# Altium schematic sheet Driver_3.SchDoc
size A; SheetNumber: 6; SheetTotal: 7
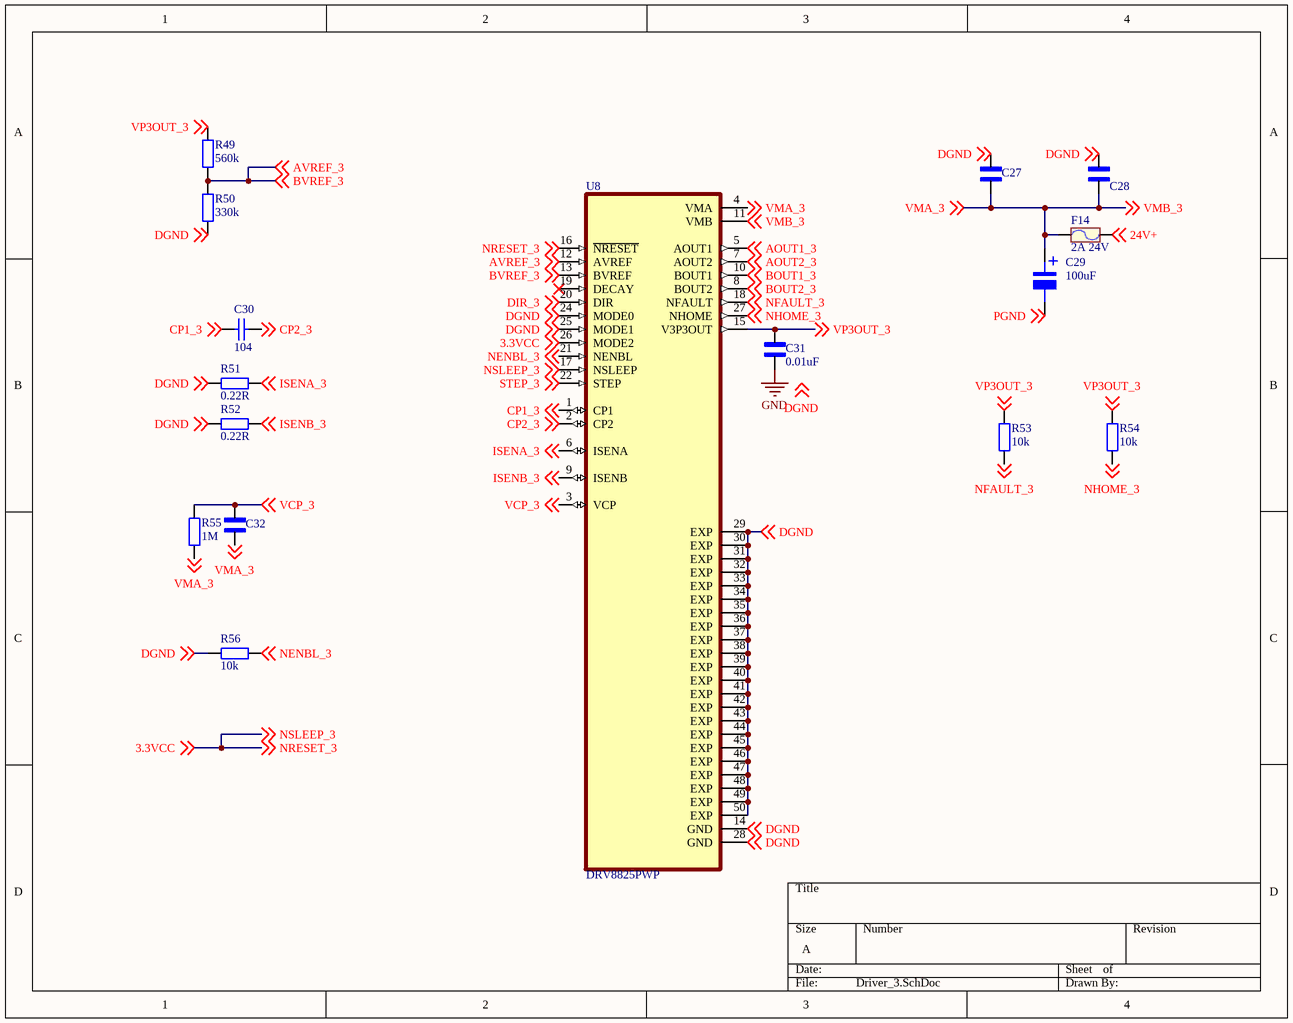
[diagram p0: Driver_3.SchDoc]

## Parts
C27  C0402C104K3RACTU  [CAPC1005X55N]  (value not drawn)
C28  C0402C104K3RACTU  [CAPC1005X55N]  (value not drawn)
C29  100uF  [tu nhom 6.3 (d)]
C30  104  [tu 1206]
C31  0.01uF  [CAPC1608X90N]
C32  C0402C104K3RACTU  [CAPC1005X55N]  (value not drawn)
F14  2A 24V  [Cau chi tu phuc hoi 2A 24V SMD1812]
R49  560k  [Tro SMD 0805]
R50  330k  [Tro SMD 0805]
R51  0.22R  [tro smd 0805]
R52  0.22R  [tro smd 0805]
R53  10k  [tro smd 0805]
R54  10k  [tro smd 0805]
R55  1M  [tro smd 0805]
R56  10k  [tro smd 0805]
U8  DRV8825PWP  [IC_TPS61196PWPRQ1]

## Nets
GND: C31.1
3.3VCC: U8.16(~{NRESET}) U8.17(NSLEEP) U8.26(MODE2) ; off-sheet 3.3VCC, off-sheet NRESET_3, off-sheet NSLEEP_3  [also labelled NRESET_3, NSLEEP_3]
24V+: F14.2 ; off-sheet 24V+
AOUT1_3: U8.5(AOUT1) ; off-sheet AOUT1_3
AOUT2_3: U8.7(AOUT2) ; off-sheet AOUT2_3
AVREF_3: R49.1 R50.2 U8.12(AVREF) U8.13(BVREF) ; off-sheet AVREF_3, off-sheet BVREF_3  [also labelled BVREF_3]
BOUT1_3: U8.10(BOUT1) ; off-sheet BOUT1_3
BOUT2_3: U8.8(BOUT2) ; off-sheet BOUT2_3
CP1_3: C30.1 U8.1(CP1) ; off-sheet CP1_3
CP2_3: C30.2 U8.2(CP2) ; off-sheet CP2_3
DGND: C27.2 C28.2 R50.1 R51.1 R52.1 R56.1 U8.14(GND) U8.24(MODE0) U8.25(MODE1) U8.28(GND) U8.29(EXP) U8.30(EXP) U8.31(EXP) U8.32(EXP) U8.33(EXP) U8.34(EXP) U8.35(EXP) U8.36(EXP) U8.37(EXP) U8.38(EXP) U8.39(EXP) U8.40(EXP) U8.41(EXP) U8.42(EXP) U8.43(EXP) U8.44(EXP) U8.45(EXP) U8.46(EXP) U8.47(EXP) U8.48(EXP) U8.49(EXP) U8.50(EXP) ; off-sheet DGND
DIR_3: U8.20(DIR) ; off-sheet DIR_3
ISENA_3: R51.2 U8.6(ISENA) ; off-sheet ISENA_3
ISENB_3: R52.2 U8.9(ISENB) ; off-sheet ISENB_3
NENBL_3: R56.2 U8.21(NENBL) ; off-sheet NENBL_3
NFAULT_3: R53.1 U8.18(NFAULT) ; off-sheet NFAULT_3
NHOME_3: R54.1 U8.27(NHOME) ; off-sheet NHOME_3
PGND: C29.2 ; off-sheet PGND
STEP_3: U8.22(STEP) ; off-sheet STEP_3
VCP_3: C32.2 R55.2 U8.3(VCP) ; off-sheet VCP_3
VMA_3: C27.1 C28.1 C29.1 C32.1 F14.1 R55.1 U8.4(VMA) U8.11(VMB) ; off-sheet VMA_3, off-sheet VMB_3  [also labelled VMB_3]
VP3OUT_3: C31.2 R49.2 R53.2 R54.2 U8.15(V3P3OUT) ; off-sheet VP3OUT_3

Not connected (* = marked no-connect by the designer): U8 19(DECAY)*

## Notes on the sheet
- Labels drawn without touching a wire or pin: DGND
- (in symbol Tu Nhom 100uF 16V) +

## Library data of the parts
C27 C28 C32 = C0402C104K3RACTU: MF: {'manufacturer': u'KEMET'}; Package: None; Price: None; Value: *; MP: C0402C104K3RACTU; Availability: Unavailable
C29 = Tu Nhom 100uF 16V: Dán; Don_Vi: Con; So_Chan: 2; Ten_Linh_Kien: Tụ Nhôm 100uF 16V 6.3x5.4MM; Ma_Hang: MH002219; Chung_Loai: Dán; Kieu_Chan: *
C30 = Tu 1206 104 50V 20%: Dán; Don_Vi: Con; So_Chan: 2; Ten_Linh_Kien: Tụ 1206 104-0.1uF 20% 50V; Ma_Hang: MH004544; Chung_Loai: Dán; Kieu_Chan: *
C31 = GCE188R72A103KA01D: 0603 0.01 uF 100 V Â±10% Tolerance X7R Multilayer Ceramic Capacitor; MF: Murata; Package: 1608 Murata; Check_prices: https://www.snapeda.com/parts/GCE188R72A103KA01D/Murata%20Electronics%20North%20America/view-part/1764845/?ref=eda; Value: *; Price: None; Purchase-URL: https://pricing.snapeda.com/search/part/GCE188R72A103KA01D/?ref=eda; MP: GCE188R72A103KA01D; Availability: Good; SnapEDA_Link: https://www.snapeda.com/parts/GCE188R72A103KA01D/Murata%20Electronics%20North%20America/view-part/1764845/?ref=snap
F14 = Cau chi tu phuc hoi 2A 24V SMD1812: 2A 24V SMD1812; Ma_Hang: MH010033; Ten: Cầu Chì Tự Phục Hồi 2A 24V SMD1812
R49 = Tro 0805 5% 560k: Dán; Don_Vi: Con; Ma_Hang: MH005342; Ten_Linh_Kien: Trở 0805 5% 560k; So_Chan: 2; Chung_Loai: Dán; Kieu_Chan: *
R50 = Tro 0805 5% 330k: Dán; Don_Vi: Con; So_Chan: 2; Ten_Linh_Kien: Trở 0805 5% 330K; Ma_Hang: MH005336; Chung_Loai: Dán; Kieu_Chan: *
R51 R52 = Tro 0805 1% 0.22R: Dán; Don_Vi: Con; So_Chan: 2; Ten_Linh_Kien: Trở 0805 1% 0.22R; Ma_Hang: MH005466; Chung_Loai: Dán; Kieu_Chan: *
R53 R54 R56 = Tro 0805 1% 10k: Dán; Don_Vi: Con; So_Chan: 2; Ten_Linh_Kien: Trở 0805 1% 10k; Ma_Hang: MH005473; Chung_Loai: Dán; Kieu_Chan: *
R55 = Tro 0805 1% 1M: Dán; Don_Vi: Con; So_Chan: 2; Ten_Linh_Kien: Trở 0805 1% 1M; Ma_Hang: MH005469; Chung_Loai: Dán; Kieu_Chan: *
U8 = DRV8825PWP: <a href="https://snapeda.com/parts/DRV8825PWP/Texas%20Instruments/view-part/?ref=eda">Buy Part</a>; Package: None; Availability: Unavailable; Value: *; MP: DRV8825PWP; Price: None